# Altium schematic sheet charger_IC.SchDoc
size A; SheetNumber: 3; SheetTotal: 4
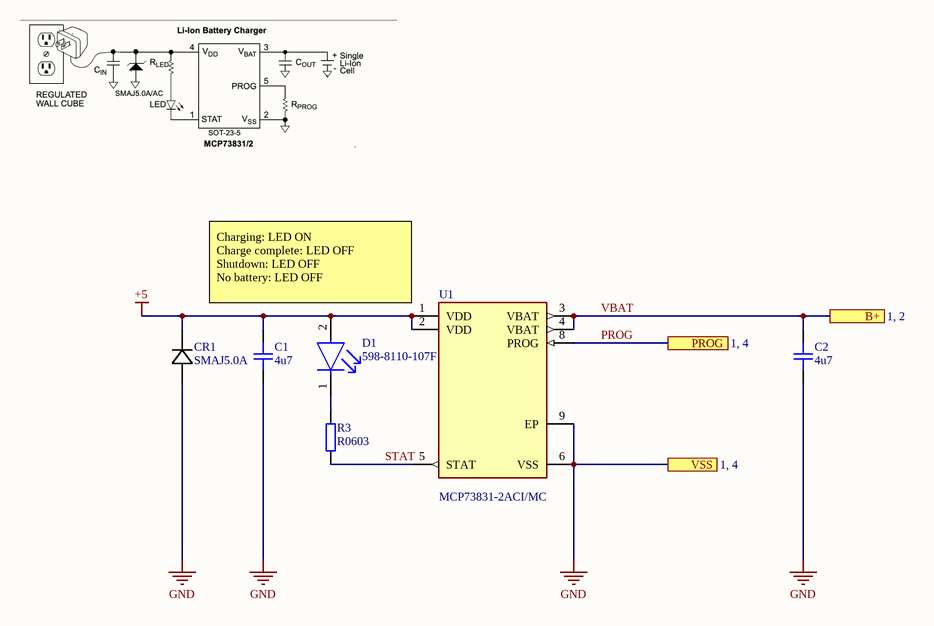
[diagram p0: charger_IC.SchDoc]

## Parts
C1  4u7  [CAP_0603]
C2  4u7  [CAP_0603]
CR1  SMAJ5.0A  [SMASeries_LTF-M]
D1  598-8110-107F  [RED_LED_0805]
R3  R0603  [RES_0603]
U1  MCP73831-2ACI/MC  [SON50P200X300X100-9N]

## Ports
B+ (see 1, 2), PROG (see 1, 4), VSS (see 1, 4)

## Nets
+5: C1.2 CR1.1 D1.2(A) U1.1(VDD) U1.2(VDD)
GND: C1.1 C2.1 CR1.2 U1.6(VSS) U1.9(EP) ; port VSS
PROG: U1.8(PROG) ; port PROG
STAT: R3.1 U1.5(STAT)
VBAT: C2.2 U1.3(VBAT) U1.4(VBAT) ; port B+
NetD1_1: D1.1(C) R3.2

## Notes on the sheet
- Charging: LED ON
  Charge complete: LED OFF
  Shutdown: LED OFF
  No battery: LED OFF

## Library data of the parts
C1 C2 = CAP_0603: Capacitor SMD 0603 / Ceramic; Manufacturer: *; Manufacturer Part Number: *; Distributor Link: *; LCSC: *; Rating: *; Dielectric: *
CR1 = SMAJ5.0A: ESD Protection Diode; Manufacturer_Name: Littelfuse Inc; Copyright: Copyright (C) 2025 Ultra Librarian. All rights reserved.; Manufacturer_Part_Number: SMAJ5.0A
D1 = RED_LED_0805: 598-8110-107F 598-8110-107F, Dialight, SMD LED 0805 Package, Red Single color SOLD IN INCREMENTS OF 4000. (REEL); NexarPartId: 868569; Wavelength: 635nm; Forward Current: 20mA; Lens Style: Clear; Forward Voltage: 2.2V; Power Dissipation: 60mW; Max Junction Temperature (Tj): 105°C; Luminous Intensity: 40mcd; Viewing Angle: 140°; Reverse Voltage: 5V; Number of LEDs: 1; Number of Pins: 2; Schedule B: 8541402000, 8541402000|8541402000, 8541402000|8541402000|8541402000, 8541402000|8541402000|8541402000|8541402000; Length: 2mm; Width: 1.25mm; Mount: Surface Mount; Height: 800µm; Case Code (Imperial): 0805; Case Code (Metric): 2012; RoHS: Compliant; Min Operating Temperature: -30°C; Color: Red; Case/Package: 0805; Depth: 1.25mm; Lead Free: Lead Free; Max Operating Temperature: 85°C; Test Current: 20mA; Illumination Color: Red; Number of Elements: 1; Dominant Wavelength: 635nm; REACH SVHC: No SVHC; Radiation Hardening: No
R3 = RES_0603: Resistor SMD 0603; Manufacturer: *; Manufacturer Part Number: *; Distributor Link: *; LCSC: *
U1 = MCP73831-2ACI/MC: Charge Controller Li-Ion/Li-Pol 15mA to 500mA 4.2V 8-Pin DFN EP | Microchip Technology Inc. MCP73831-2ACI/MC; SnapEDA_Link: https://www.snapeda.com/parts/MCP73831-2ACI/MC/Microchip/view-part/?ref=snap; Package: VFDFN-8 Microchip; Value: *; MF: Microchip; MP: MCP73831-2ACI/MC; Check_prices: https://www.snapeda.com/parts/MCP73831-2ACI/MC/Microchip/view-part/?ref=eda